# EasyEDA Pro project PMT_SignalAmp.eprj

# Schematic Schematic1
Board Name: Board1; Create Date: 2025-11-17; Page Name: P1; Project Name: PMT_SignalAmp; Schematic Name: Schematic1; Update Date: 2025-11-16; Company: EasyEDA.com; Page Size: A4; Version: V1.0
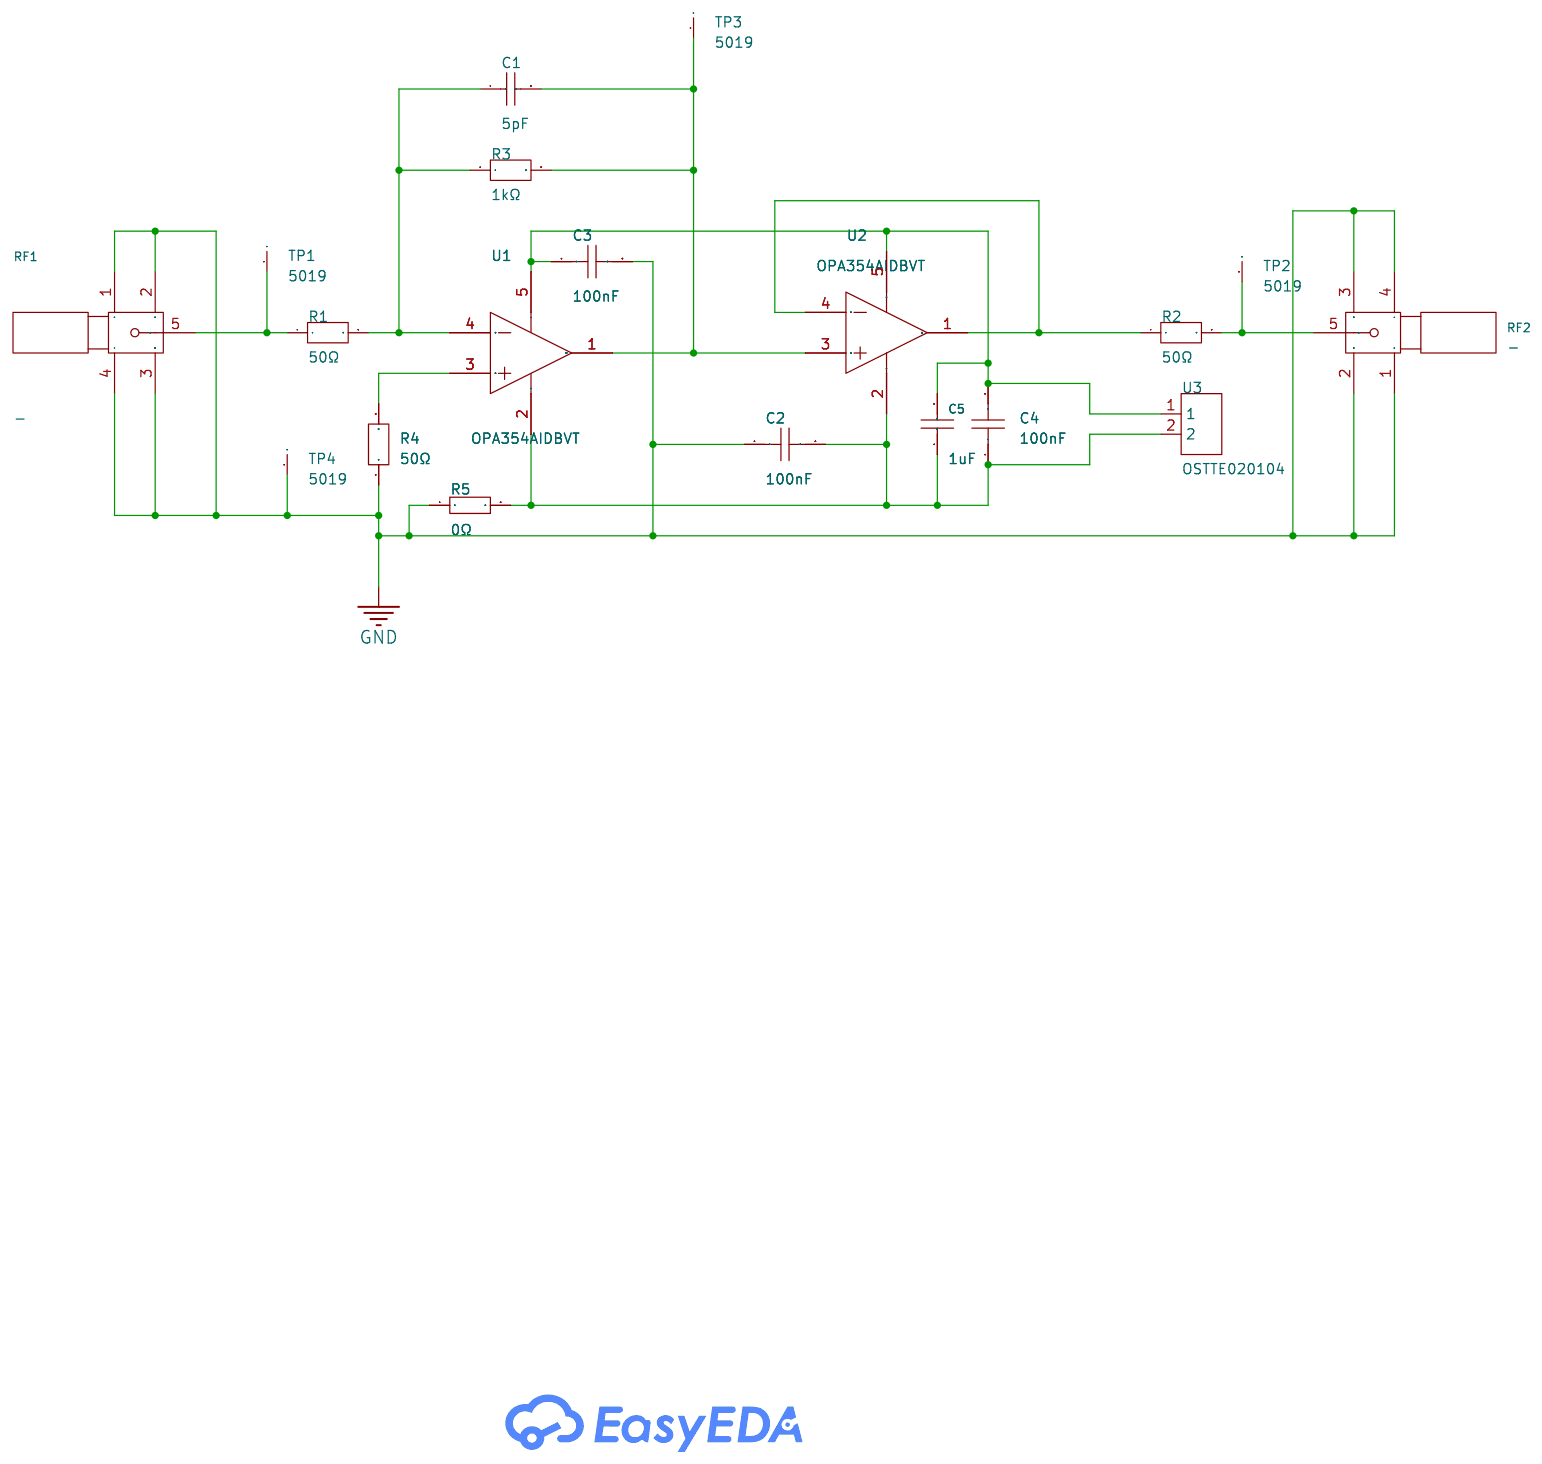
[diagram p0: schematic sheet]

## Parts
C1  5pF  [C0603]
C2  100nF  [C0603]
C3  100nF  [C0603]
C4  100nF  [C0603]
C5  1uF  [C0805]
R1  50Ω  [R0603]
R2  50Ω  [R0603]
R3  1kΩ  [R0603]
R4  50Ω  [R0603]
R5  0Ω  [R0603]
RF1  -  [SMA-TH_BWSMA-KWE-Z001]
RF2  -  [SMA-TH_BWSMA-KWE-Z001]
TP1  5019  [CONN-SMD_5019]
TP2  5019  [CONN-SMD_5019]
TP3  5019  [CONN-SMD_5019]
TP4  5019  [CONN-SMD_5019]
U1  OPA354AIDBVT  [SOT-23-5_L3.0-W1.7-P0.95-LS2.8-BR]
U2  OPA354AIDBVT  [SOT-23-5_L3.0-W1.7-P0.95-LS2.8-BR]
U3  OSTTE020104  [CONN-TH_2P-P3.50_OSTTE020104]

## Library data of the parts
C1 = 0603CG5R0C500NT: LCSC Part Name: ±0.25pF 5pF 50V; Supplier Part: C1673; Manufacturer: FH(风华); Supplier Footprint: 0603; JLCPCB Part Class: Extended Part; Datasheet: https://item.szlcsc.com/datasheet/0603CG5R0C500NT/2025.html; Supplier: LCSC; Voltage Rating: 50V; Temperature Coefficient: C0G
C2-C4 = CC0603KRX7R9BB104: LCSC Part Name: 100nF ±10% 50V; Supplier Part: C14663; Manufacturer: YAGEO(国巨); Supplier Footprint: 0603; JLCPCB Part Class: Basic Part; Datasheet: https://item.szlcsc.com/datasheet/CC0603KRX7R9BB104/15331.html; Supplier: LCSC; Tolerance: ±10%; Voltage Rating: 50V; Temperature Coefficient: X7R
C5 = CL21B105KBFNNNE: LCSC Part Name: 1uF ±10% 50V; Supplier Part: C28323; Manufacturer: SAMSUNG(三星); Supplier Footprint: 0805; JLCPCB Part Class: Basic Part; Datasheet: https://item.szlcsc.com/datasheet/CL21B105KBFNNNE/29074.html; Supplier: LCSC; Tolerance: ±10%; Voltage Rating: 50V; Temperature Coefficient: X7R
R1 R2 R4 = CRCW060350R0FKEA: LCSC Part Name: 厚膜电阻 50Ω ±1% 100mW; Supplier Part: C844932; Manufacturer: VISHAY(威世); Supplier Footprint: 0603; JLCPCB Part Class: Extended Part; Datasheet: https://item.szlcsc.com/datasheet/CRCW060350R0FKEA/904506.html; Supplier: LCSC; Type: Thick Film Resistors; Tolerance: ±1%; Power(Watts): 100mW; Temperature Coefficient: ±100ppm/℃; Operating Temperature: -55℃~+155℃
R3 = FRC0603F1001TS: LCSC Part Name: 1kΩ ±1% 100mW 厚膜电阻; Supplier Part: C2907002; Manufacturer: FOJAN(富捷); Supplier Footprint: 0603; JLCPCB Part Class: Extended Part; Supplier: LCSC; Type: Thick Film Resistor; Tolerance: ±1%; Power(Watts): 100mW; Voltage-Supply(Max): 75V; Temperature Coefficient: ±100ppm/℃; Operating Temperature: -55℃~+155℃
R5 = 0603WAF0000T5E: LCSC Part Name: 0Ω ±1% 100mW 厚膜电阻; Supplier Part: C21189; Manufacturer: UNI-ROYAL(厚声); Supplier Footprint: 0603; JLCPCB Part Class: Basic Part; Datasheet: https://item.szlcsc.com/datasheet/0603WAF0000T5E/21903.html; Supplier: LCSC; Type: Thick Film Resistor; Tolerance: ±1%; Power(Watts): 100mW; Voltage-Supply(Max): 75V; Operating Temperature: -55℃~+155℃
RF1 RF2 = BWSMA-KWE-Z001: LCSC Part Name: 内孔 SMA 弯头; Supplier Part: C496551; Manufacturer: BAT WIRELESS(蝙蝠无线); Supplier Footprint: 插件; JLCPCB Part Class: Extended Part; Datasheet: https://item.szlcsc.com/datasheet/BWSMA-KWE-Z001/508500.html; Supplier: LCSC; Connector Type: Board Side; Interface: Inner Bore; Number of Ports: 1; Interface Diameter: 5.3mm; RF Series: SMA; Impedance: 50Ω; Style: Elbow
TP1-TP4 = 5019: Supplier Part: C238131; Manufacturer: Keystone; JLCPCB Part Class: Extended Part; Datasheet: https://atta.szlcsc.com/upload/public/pdf/source/20241111/B41DD7C4F217EFE2A4E662B9E95EFAE0.pdf; Supplier: LCSC; Connector Type: Iron ring type (patch); Plastic Color: No plastic; Board Space (Diameter φ/ Length x Width): 3mmx1.6mm
U1 U2 = OPA354AIDBVT: LCSC Part Name: 250 MHz带宽、轨到轨输入输出CMOS运算放大器; Supplier Part: C133550; Manufacturer: TI(德州仪器); Supplier Footprint: SOT-23-5; JLCPCB Part Class: Extended Part; Datasheet: https://www.ti.com/cn/lit/gpn/opa354; Supplier: LCSC; Number of Channels: Single channel; Gain Bandwidth Product: 100MHz; Ib - Input Bias Current: 3pA; Slew Rate: 150V/us; -3dB Bandwidth: 250MHz; Output Current: 100mA; Quiescent Current per Amplifier: 4.9mA; Operating Temperature: -40℃~+125℃
U3 = OSTTE020104: LCSC Part Name: 3.5mm 1x2P 排数:1 每排P数:2 直插; Supplier Part: C3818107; Manufacturer: On-Shore Tech; Supplier Footprint: 插件,P=3.5mm; JLCPCB Part Class: Extended Part; Datasheet: https://item.szlcsc.com/datasheet/OSTTE020104/4385781.html; Supplier: LCSC; Number of Positions or Pins: 1x2P; Pitch: 3.5mm; Color: Black; Mounting Type: Through Hole; Number of Pins: 2P; Number of Rows: 1; Number of PINs Per Row: 2; Current Rating: 10A; Voltage Rating (Max): 125V; Wire Gauge - AWG: 16~26; Operating Temperature: -40℃~+115℃

## Nets
GND: C2.1 C3.2 R4.1 R5.1 RF1.1 RF1.2 RF1.3 RF1.4 RF2.1 RF2.2 RF2.3 RF2.4 TP4.1
$1N210: C1.2 R3.2 TP3.1 U1.1(OUT) U2.3(IN+)
$1N225: R2.1 U2.1(OUT) U2.4(IN-)
$1N444: C1.1 R1.2 R3.1 U1.4(IN-)
$1N495: R1.1 RF1.5 TP1.1
$1N511: R2.2 RF2.5 TP2.1
$1N521: C3.1 C4.2 C5.2 U1.5(V+) U2.5(V+) U3.1
$1N527: C2.2 C4.1 C5.1 R5.2 U1.2(V-) U2.2(V-) U3.2
$1N1225: R4.2 U1.3(IN+)

# Board PCB1
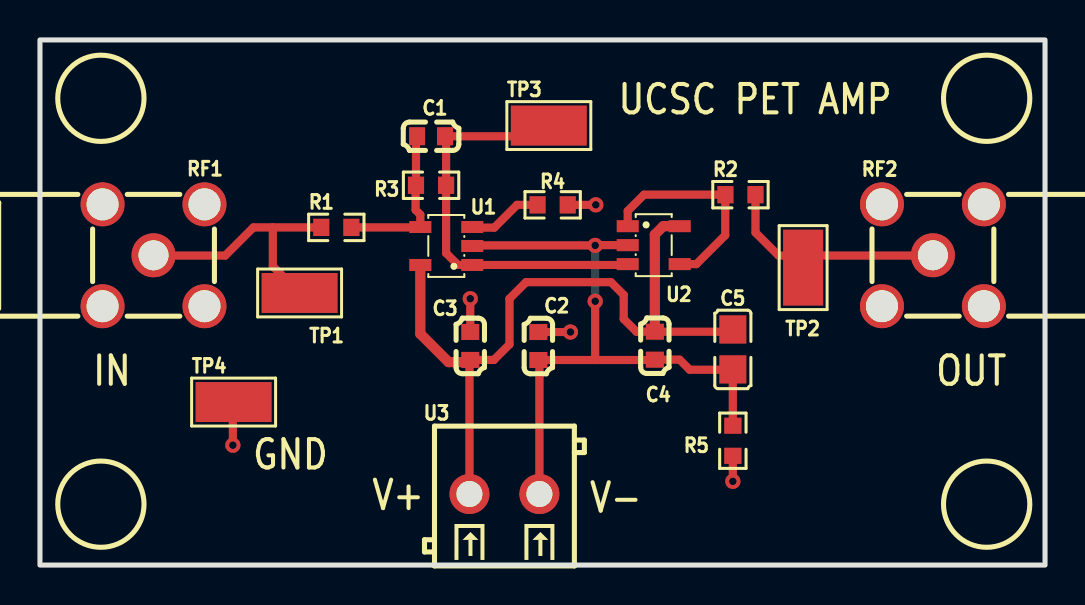
[diagram p1: board, top side]
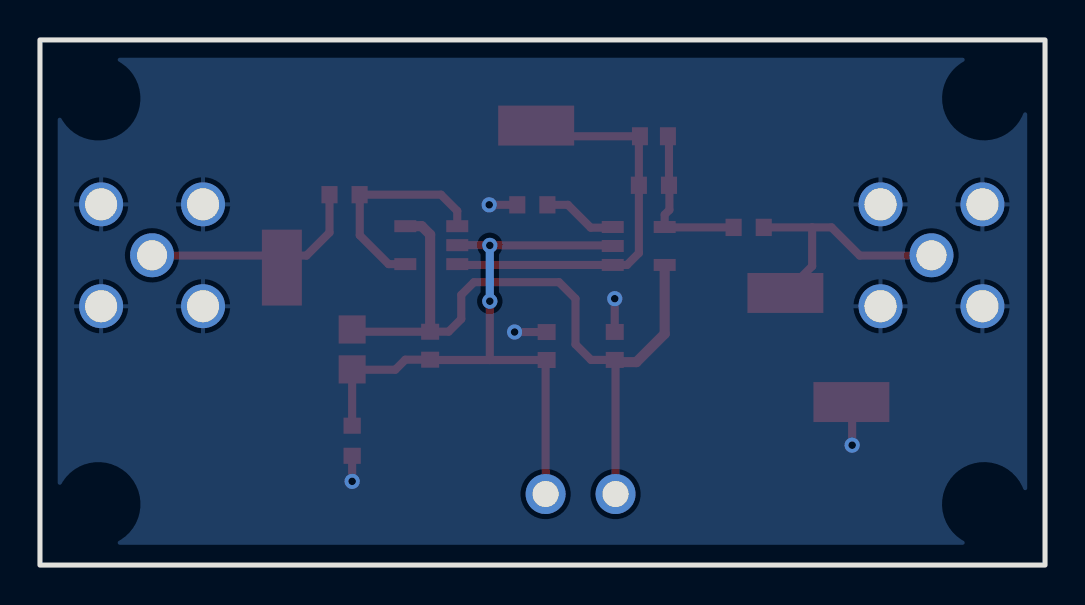
[diagram p2: board, bottom side, seen from below]

Outline 50.29 x 26.29 mm; copper layers: Top Layer, Bottom Layer. Coordinates in mm from the lower left corner of the outline.
Outline path: rectangle 0,26.29 50.29,0
Stack: Top Layer 0.035mm / Dielectric1 1.51mm FR4 er 4.5 / Bottom Layer 0.035mm

## Design rules (mm)
template: JLCPCB Capability(Two Layers Board)
spacing copperThickness1oz (default): track to track 0.102, other pairs 0.152 to 0.3
spacing copperThickness2oz: track to track 0.203, other pairs 0.152 to 0.3
track width copperThickness1oz (default): min 0.127, default 0.254, max 2.54
track width copperThickness2oz: min 0.203, default 0.254, max 2.54
differential pair differentialPair (default): width min 0.127, default 0.254, max 2.54; gap min 0.152, default 0.152
via viaSize (default): diameter min 0.5, default 0.61, max 10; hole min 0.3, default 0.305, max 6.3

## Placement (name value [footprint] x y rotation side)
C1  5pF  [C0603]  19.57 21.47 0 top
C2  100nF  [C0603]  24.94 10.97 270 top
C3  100nF  [C0603]  21.53 10.97 90 top
C4  100nF  [C0603]  30.77 10.98 90 top
C5  1uF  [C0805]  34.67 10.8 90 top
R1  50Ω  [R0603]  14.83 16.91 0 top
R2  50Ω  [R0603]  35.05 18.54 0 top
R3  1kΩ  [R0603]  19.57 19.01 0 top
R4  50Ω  [R0603]  25.65 18.03 180 top
R5  0Ω  [R0603]  34.67 6.22 90 top
RF1  -  [SMA-TH_BWSMA-KWE-Z001]  5.68 15.51 180 top
RF2  -  [SMA-TH_BWSMA-KWE-Z001]  44.68 15.51 0 top
TP1  5019  [CONN-SMD_5019]  12.99 13.62 180 top
TP2  5019  [CONN-SMD_5019]  38.19 14.89 90 top
TP3  5019  [CONN-SMD_5019]  25.46 22 0 top
TP4  5019  [CONN-SMD_5019]  9.69 8.16 0 top
U1  OPA354AIDBVT  [SOT-23-5_L3.0-W1.7-P0.95-LS2.8-BR]  20.33 15.97 0 top
U2  OPA354AIDBVT  [SOT-23-5_L3.0-W1.7-P0.95-LS2.8-BR]  30.71 16.02 180 top
U3  OSTTE020104  [CONN-TH_2P-P3.50_OSTTE020104]  23.24 3.56 0 top

## Footprints (pads in the part's own frame, mm; a bottom-side part is the same pattern mirrored in y, then rotated)
C0603
  rect 0.8x0.9 smd: 1(-0.7,0) 2(0.7,0)
C0805
  rect 1.41x1.35 smd: 1(-1,0) 2(1,0)
CONN-SMD_5019
  rect 3.8x2 smd: 1(0,0)
CONN-TH_2P-P3.50_OSTTE020104
  round 2 hole 1.3: 1(-1.75,0) 2(1.75,0)
R0603
  rect 0.806x0.864 smd: 1(-0.753,0) 2(0.753,0)
SMA-TH_BWSMA-KWE-Z001
  round 2.2 hole 1.6: 1(-2.55,-2.55) 2(-2.55,2.55) 3(2.55,2.55) 4(2.55,-2.55)
  round 2.2 hole 1.5: 5(0,0)
SOT-23-5_L3.0-W1.7-P0.95-LS2.8-BR
  rect 1.1x0.6 smd: 1(1.3,-0.95) 2(1.3,0) 3(1.3,0.95) 4(-1.3,0.95) 5(-1.3,-0.95)

## Nets
As in the schematic.

## Via types
v1: diameter 0.762, hole 0.381, Top Layer to Bottom Layer, 7 vias

## Routing (per net, layer and track width the routed paths; a pad name or vN(x,y) marks a point on that pad's centre or on a via; arc(x,y) is an arc through that point)
GND: length 8.1
  Top Layer w0.406: R5.1 v1(34.67,4.19) ; v1(9.65,6) 9.65,8.12 TP4.1 ; R4.1 v1(27.81,18.03) ; C3.2 v1(21.53,13.33) ; C2.1 v1(26.54,11.67)
$1N210: length 20.6
  Top Layer w0.406: U2.3 29.37,15.02 U1.1 20.92,15.02 20.32,15.62 R3.2 20.32,21.41 C1.2 24.93,21.47 TP3.1
$1N225: length 10.9
  Top Layer w0.406: U2.4 32.85,15.07 34.29,16.51 34.29,18.53 R2.1 30.23,18.54 29.41,17.73 U2.1
$1N444: length 8.3
  Top Layer w0.406: C1.1 18.82,21.41 R3.1 18.8,18.99 18.8,17.78 19.03,17.54 U1.4 19.01,16.91 15.45,16.91
$1N495: length 12.8
  Top Layer w0.406: RF1.5 5.7,15.49 9.27,15.49 10.68,16.91 11.65,16.91 ; 11.65,16.91 11.65,14.96 TP1.1 ; 11.65,16.91 R1.1
$1N511: length 11.3
  Top Layer w0.406: R2.2 35.81,16.65 36.96,15.49 44.67,15.49 RF2.5
$1N521: length 37.3
  Top Layer w0.406: C5.2 34.56,11.68 C4.2 30.77,11.68 29.84,11.68 29.21,12.32 29.21,13.53 28.57,14.16 24.32,14.16 23.5,13.33 23.5,11.05 22.72,10.27 C3.1 21.49,10.23 U3.1
  Top Layer w0.508: 21.42,10.16 20.45,10.16 19.03,11.57 U1.5 ; C4.2 30.77,16.54 31.19,16.97 U2.5
$1N527: length 33
  Top Layer w0.406: 27.78,10.27 30.75,10.27 C4.1 32.01,10.28 32.51,9.78 34.66,9.78 C5.1 R5.2 ; 27.78,10.27 C2.2 24.99,10.21 U3.2 ; 27.78,10.27 v1(27.78,13.21) ; U1.2 21.66,16 v1(27.78,16) 27.8,16.02 U2.2
  Bottom Layer w0.406: v1(27.78,13.21) v1(27.78,16)
$1N1225: length 3.6
  Top Layer w0.406: 24.77,18.03 23.88,18.03 22.73,16.89 21.66,16.89 U1.3

## Copper pours and planes (outline as drawn; the poured copper is in the pictures)
GND on Bottom Layer: 0.89,25.4 49.4,25.4 49.4,1.02 0.89,1.02

## Text on the board
Top Silkscreen Layer: IN | GND | V+ | V- | UCSC PET AMP | OUT
